# Altium schematic sheet 05_SENSORES.SchDoc: Sensores, RTC y sonda 1-Wire
size 420 x 297 mm; Address1: Hardware en IoT · 2026; SheetNumber: 5; SheetTotal: 6
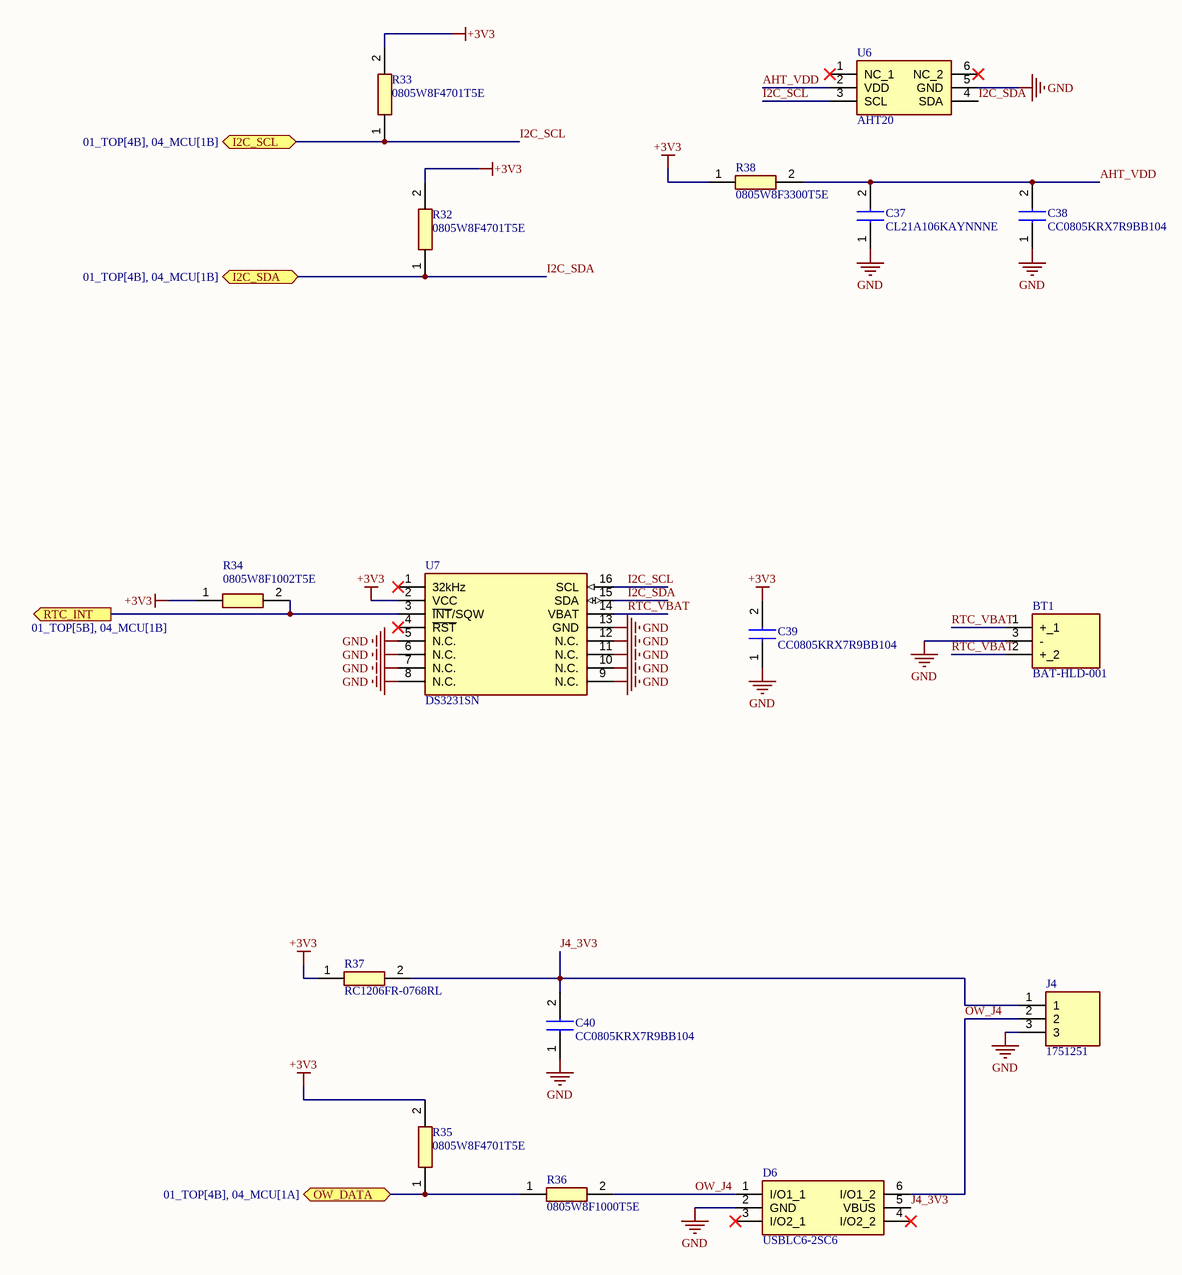
[diagram p0: 05_SENSORES.SchDoc]

## Parts
BT1  BAT-HLD-001  [BATHLD001]
C37  CL21A106KAYNNNE  [CAPC2012X145N]
C38  CC0805KRX7R9BB104  [CAPC2012X88N]
C39  CC0805KRX7R9BB104  [CAPC2012X88N]
C40  CC0805KRX7R9BB104  [CAPC2012X88N]
D6  USBLC6-2SC6  [SOT95P280X145-6N]
J4  1751251  [1751251]
R32  0805W8F4701T5E  [RESC2012X60N]
R33  0805W8F4701T5E  [RESC2012X60N]
R34  0805W8F1002T5E  [RESC2012X60N]
R35  0805W8F4701T5E  [RESC2012X60N]
R36  0805W8F1000T5E  [RESC2012X60N]
R37  RC1206FR-0768RL  [ERJP08_(1206)]
R38  0805W8F3300T5E  [RESC2012X60N]
U6  AHT20  [AHT20]
U7  DS3231SN  [SOIC127P1030X265-16N]

## Ports
I2C_SCL (bidir, see 01_TOP[4B], 04_MCU[1B]), I2C_SDA (bidir, see 01_TOP[4B], 04_MCU[1B]), OW_DATA (bidir, see 01_TOP[4B], 04_MCU[1A]), RTC_INT (out, see 01_TOP[5B], 04_MCU[1B])

## Nets
+3V3: C39.2 R32.2 R33.2 R34.1 R35.2 R37.1 R38.1 U7.2(VCC)
GND: BT1.3(-) C37.1 C38.1 C39.1 C40.1 D6.2(GND) J4.3 U6.5(GND) U7.5(N.C.) U7.6(N.C.) U7.7(N.C.) U7.8(N.C.) U7.9(N.C.) U7.10(N.C.) U7.11(N.C.) U7.12(N.C.) U7.13(GND)
AHT_VDD: C37.2 C38.2 R38.2 U6.2(VDD)
I2C_SCL: R33.1 U6.3(SCL) U7.16(SCL) ; port I2C_SCL
I2C_SDA: R32.1 U6.4(SDA) U7.15(SDA) ; port I2C_SDA
J4_3V3: C40.2 D6.5(VBUS) J4.1 R37.2
OW_DATA: R35.1 R36.1 ; port OW_DATA
OW_J4: D6.1(I/O1_1) D6.6(I/O1_2) J4.2 R36.2
RTC_INT: R34.2 U7.3(~{INT}/SQW) ; port RTC_INT
RTC_VBAT: BT1.1(+_1) BT1.2(+_2) U7.14(VBAT)

Not connected (* = marked no-connect by the designer): D6 3(I/O2_1)* 4(I/O2_2)*; U6 1(NC_1)* 6(NC_2)*; U7 1(32kHz)* 4(~{RST})*

## Notes on the sheet
- CONTROL DE CARGA EVSE · HARDWARE EN IOT 2026
- DISEÑO: NICOLÁS GÓMEZ RAMÍREZ
- DWG NO:
- REVISION
- REV:
- DESCRIPTION
- DATE
- APPROVED
- ZONA DE RED 120–240 VAC CON AISLAMIENTO REFORZADO
- USO ACADÉMICO, SIN GARANTÍA.
- ENG:
- APPROVALS
- PROJECT
- DSN:
- CHK:
- REFERENCE DOCUMENTS
- PROJECT REVISION:
- TITLE
- DOCUMENT REVISION:
- DESIGN BY:
- BOM:
- FAB DWG:
- PCB DWG:
- ASSY DWG:
- SCALE:
- A3
- SIZE
- CAGE CODE
- FILE NAME
- DWG NO.
- SHEET
- OF
- REV

## Library data of the parts
BT1 = BAT-HLD-001: Battery holder CR2032, SMD; Manufacturer_Name: TE Connectivity; Assembly: JLCPCB; Value: CR2032; Supplier: JLCPCB; Supplier PN: LCSC C7501066; Datasheet Link: https://www.te.com/commerce/DocumentDelivery/DDEController?Action=showdoc&DocId=Customer+Drawing%7FC-BAT-HLD-001-xx%7FE%7Fpdf%7FEnglish%7FENG_CD_C-BAT-HLD-001-xx_E.pdf%7FBAT-HLD-001; Height: 4.3mm; Manufacturer_Part_Number: BAT-HLD-001
C37 = CL21A106KAYNNNE: Capacitor; Manufacturer_Name: Samsung Electro-Mechanics; Assembly: JLCPCB; Value: 10uF 25V; Datasheet Link: https://datasheet.datasheetarchive.com/originals/distributors/Datasheets_SAMA/6a45835c9b7400e9b49c55c38a8ff4a2.pdf; Height: 1.45mm; Manufacturer_Part_Number: CL21A106KAYNNNE; Supplier: JLCPCB; Supplier PN: LCSC C15850
C38-C40 = CC0805KRX7R9BB104: Capacitor 100 nF 50 V X7R 10% 0805; Manufacturer_Name: YAGEO; Assembly: JLCPCB; Manufacturer_Part_Number: CC0805KRX7R9BB104; Supplier: JLCPCB; Supplier PN: LCSC C49678; Value: 100nF 50V X7R
D6 = USBLC6-2SC6: Integrated Circuit; Manufacturer_Name: STMicroelectronics; Value: ESD USB; Assembly: JLCPCB; Supplier: JLCPCB; Supplier PN: LCSC C7519; Datasheet Link: https://www.st.com/resource/en/datasheet/usblc6-2.pdf; Height: 1.45mm; Manufacturer_Part_Number: USBLC6-2SC6
J4 = 1751251: Connector; Manufacturer_Name: Phoenix Contact; Value: 3P 3.5mm; Assembly: JLCPCB; Datasheet Link: https://www.phoenixcontact.com/en-us/products/printed-circuit-board-terminal-mkds-1-3-35-1751251?type=pdf; Height: 8.65mm; Manufacturer_Part_Number: 1751251; Supplier: JLCPCB; Supplier PN: LCSC C91152
R32 R33 R35 = 0805W8F4701T5E: Resistor 4.7 kOhm 1% 125 mW 0805; Manufacturer_Name: UNI-ROYAL; Value: 4.7k; Assembly: JLCPCB; Manufacturer_Part_Number: 0805W8F4701T5E; Supplier: JLCPCB; Supplier PN: LCSC C17673
R34 = 0805W8F1002T5E: Resistor 10 kOhm 1% 125 mW 0805; Manufacturer_Name: UNI-ROYAL; Value: 10k; Assembly: JLCPCB; Manufacturer_Part_Number: 0805W8F1002T5E; Supplier: JLCPCB; Supplier PN: LCSC C17414
R36 = 0805W8F1000T5E: Resistor 100 Ohm 1% 125 mW 0805; Manufacturer_Name: UNI-ROYAL; Value: 100R; Assembly: JLCPCB; Manufacturer_Part_Number: 0805W8F1000T5E; Supplier: JLCPCB; Supplier PN: LCSC C17408
R37 = RC1206FR-0768RL: Resistor; Manufacturer_Name: Yageo; Assembly: JLCPCB; Value: 68R 1206; Manufacturer_Part_Number: RC1206FR-0768RL; Supplier: JLCPCB; Supplier PN: LCSC C137238
R38 = 0805W8F3300T5E: Resistor 330 Ohm 1% 125 mW 0805; Manufacturer_Name: UNI-ROYAL; Value: 330R; Assembly: JLCPCB; Manufacturer_Part_Number: 0805W8F3300T5E; Supplier: JLCPCB; Supplier PN: LCSC C17630
U6 = AHT20: Integrated Circuit; Manufacturer_Name: Aosong; Value: T/HR I2C 0x38; Assembly: JLCPCB; Datasheet Link: https://www.lcsc.com/datasheet/C2757850.pdf; Height: 1.1mm; Manufacturer_Part_Number: AHT20; Supplier: JLCPCB; Supplier PN: LCSC C2757850
U7 = DS3231SN: I2C RTC with integrated TCXO and crystal, VBAT, SO-16W; Manufacturer_Name: Analog Devices; Manufacturer_Part_Number: DS3231SN#T&R; Assembly: JLCPCB; Value: RTC TCXO 2ppm; Datasheet Link: https://www.analog.com/media/en/technical-documentation/data-sheets/DS3231.pdf; Height: 2.65mm; Supplier: JLCPCB; Supplier PN: LCSC C9866